# Altium schematic sheet PowerManagement.SchDoc: Alimentação e proteções
size 420 x 297 mm; Author: Matheus Markies; DrawnBy: Matheus Markies; Engineer: Matheus Markies; DocumentNumber: ECTU-SCH-09; Revision: A definir; SheetNumber: 9; SheetTotal: 12; ProjectTitle: ROUTE ECU / ECTU; DocumentStatus: Em desenvolvimento; DocumentDate: 14/10/2026
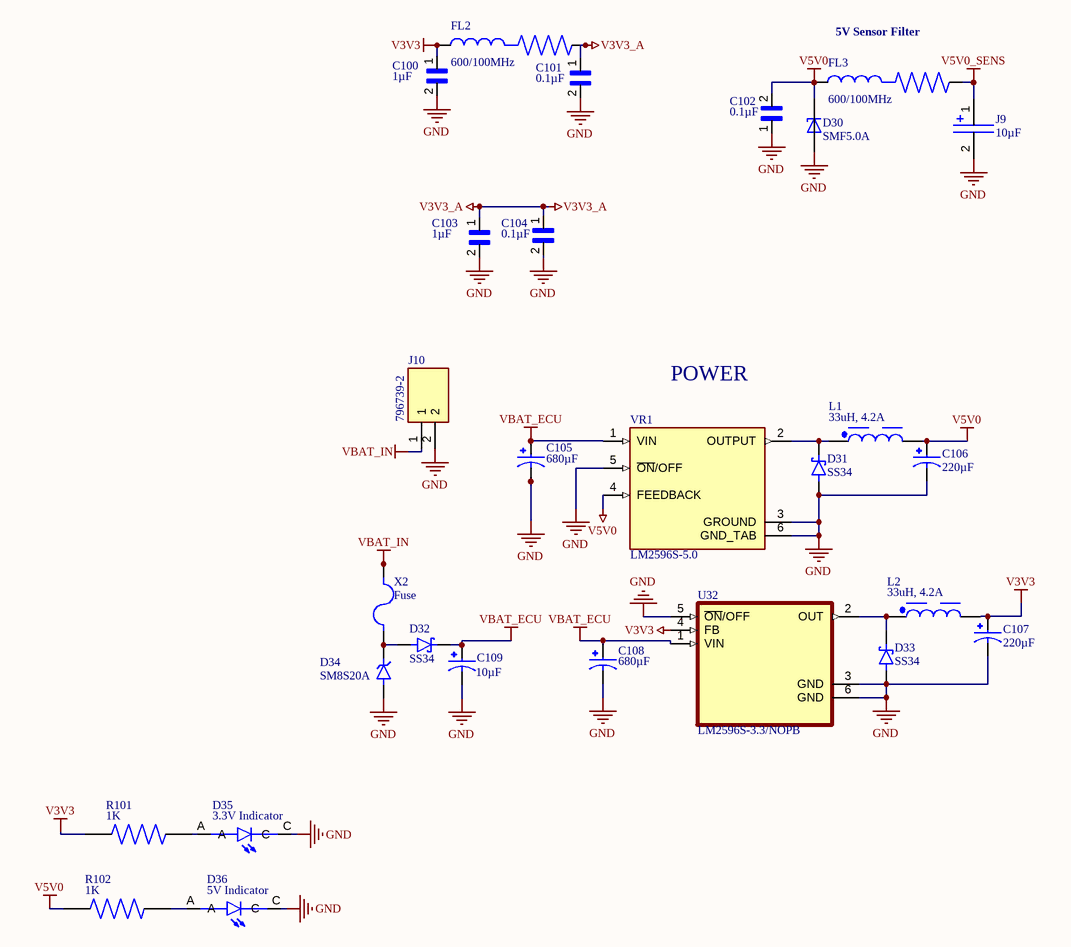
[diagram p0: PowerManagement.SchDoc]

## Parts
C100  1µF  [CAPC1608X90N]
C101  0.1µF  [CAPC1608X90N]
C102  0.1µF  [CAPC1608X90N]
C103  1µF  [CAPC1608X90N]
C104  0.1µF  [CAPC1608X90N]
C105  680µF  [CAP_EEEFN1E681UV]
C106  220µF  [CAP_EEEFP1V221AV]
C107  220µF  [CAP_EEEFP1V221AV]
C108  680µF  [CAP_EEEFN1E681UV]
C109  10µF  [CAPPRD500W50D500H1100]
D30  SMF5.0A  [SODFL3718X102N]
D31  SS34  [DIO_SS34]
D32  SS34  [DIO_SS34]
D33  SS34  [DIO_SS34]
D34  SM8S20A  [TVSP_SM8S36A]
D35  3.3V Indicator  [LEDC2012X70N]
D36  5V Indicator  [LEDC2012X70N]
FL2  600/100MHz  [BEADC1608X95N]
FL3  600/100MHz  [BEADC1608X95N]
J9  10µF  [T491A106K010AT]
J10  796739-2  [TE_796739-2]
L1  33uH, 4.2A  [WE-PD_1210]
L2  33uH, 4.2A  [WE-PD_1210]
R101  1K  [RESC3116X65N]
R102  1K  [RESC3116X65N]
U32  LM2596S-3.3/NOPB  [VREG_LM2596S-3.3/NOPB]
VR1  LM2596S-5.0  [TO170P1524X483-6N]
X2  Fuse  [FUSE_3522-2]

## Nets
GND: C100.2 C101.2 C102.1 C103.2 C104.2 C105.2 C106.2 C107.2 C108.2 C109.N D30.A D31.A D33.A D34.2(A) D35.C D36.C J9.2(P$2) J10.2 U32.3(GND) U32.5(~{ON}/OFF) U32.6(GND) VR1.3(GROUND) VR1.5(~{ON}/OFF) VR1.6(GND_TAB)
V3V3: C100.1 C107.1 FL2.1 L2.2 R101.1 U32.4(FB)
V3V3_A: C101.1 C103.1 C104.1 FL2.2
V5V0: C102.2 C106.1 D30.C FL3.1 L1.2 R102.1 VR1.4(FEEDBACK)
V5V0_SENS: FL3.2 J9.1(P$1)
VBAT_ECU: C105.1 C108.1 C109.P D32.C(K) U32.1(VIN) VR1.1(VIN)
VBAT_IN: J10.1 X2.2A X2.2B
NetD31_C: D31.C(K) L1.1 VR1.2(OUTPUT)
NetD32_A: D32.A D34.1(K) X2.1A X2.1B
NetD33_C: D33.C(K) L2.1 U32.2(OUT)
NetD35_A: D35.A R101.2
NetD36_A: D36.A R102.2

## Notes on the sheet
- (near FL3) 5V Sensor Filter
- POWER
- PROJETO
- STATUS
- FOLHA / SUBSISTEMA
- AUTOR
- CÓDIGO DO DESENHO
- ARQUIVO
- ATUALIZAÇÃO
- REVISÃO
- FOLHA
- FORMATO
- A3
- /

## Library data of the parts
C100-C104 = 06035C104MAZ2A: Multilayer Ceramic Capacitors MLCC - SMD/SMT; Package: None; Price: None; Value: *; MP: 06035C104MAZ2A; Availability: Unavailable
C105 C108 = EEEFN1E681UV: CAP ALUM 680UF 20% 25V SMD; MF: Panasonic Electronic Components; MP: EEE-FN1E681UV; Value: *; Purchase-URL: https://pricing.snapeda.com/search/part/EEE-FN1E681UV/?ref=eda; Price: None; Check_prices: https://www.snapeda.com/parts/EEE-FN1E681UV/Panasonic/view-part/6178425/?ref=eda; Package: RADIAL-2 Panasonic; Availability: In Stock; SnapEDA_Link: https://www.snapeda.com/parts/EEE-FN1E681UV/Panasonic/view-part/6178425/?ref=snap
C106 C107 = EEEFP1V221AV: CAP ALUM 220UF 20% 35V SMD; MF: Panasonic Electronic Components; MP: EEE-FP1V221AV; SnapEDA_Link: https://www.snapeda.com/parts/EEE-FP1V221AV/Panasonic/view-part/4900934/?ref=snap; Price: None; Availability: Not in stock; Value: *; Check_prices: https://www.snapeda.com/parts/EEE-FP1V221AV/Panasonic/view-part/4900934/?ref=eda; Package: RADIAL-2 Panasonic
C109 = ECEA1EN100UB: 10ÂµF 25V Aluminum Electrolytic Capacitors Radial, Can 2000 Hrs @ 85Â°C; MF: Panasonic; SnapEDA_Link: https://www.snapeda.com/parts/ECEA1EN100UB/Panasonic/view-part/?ref=snap; Price: None; Check_prices: https://www.snapeda.com/parts/ECEA1EN100UB/Panasonic/view-part/?ref=eda; Purchase-URL: https://pricing.snapeda.com/search/part/ECEA1EN100UB/?ref=eda; Package: RADIAL-2 Panasonic; MP: ECEA1EN100UB; Value: *; Availability: In Stock
D30 = SMF5.0A: 200W, 6.7V, 5%, Unidirectional, TVS; MF: Taiwan Semiconductor; SnapEDA_Link: https://www.snapeda.com/parts/SMF5.0A/taiwan/view-part/?ref=snap; Package: SOD-123W-2 Taiwan Semiconductor; Value: *; MP: SMF5.0A; Check_prices: https://www.snapeda.com/parts/SMF5.0A/taiwan/view-part/?ref=eda
D31-D33 = SS34: 3A, 40V, Schottky Rectifier; MF: Taiwan Semiconductor; Package: DO-214AB-2 Taiwan Semiconductor; Value: *; MP: SS34
  D31 D33: SnapEDA_Link: https://www.snapeda.com/parts/SS34/Taiwan+Semiconductor/view-part/?ref=snap; Check_prices: https://www.snapeda.com/parts/SS34/Taiwan+Semiconductor/view-part/?ref=eda
  D32: SnapEDA_Link: https://www.snapeda.com/parts/SS34/taiwan/view-part/?ref=snap; Check_prices: https://www.snapeda.com/parts/SS34/taiwan/view-part/?ref=eda
D34 = SM8S36A: Package: None; Price: None; Value: *; MP: SM8S36A; Availability: Unavailable
D35 D36 = 597-3305-607F: LED Uni-Color Green 4-Pin Chip 0805 T/R; Availability: Unavailable; Value: *; Price: None; MP: 597-3305-607F; Package: None
FL2 FL3 = BLM18DN601SZ1D: 600 Ohms @ 100MHz 1 Ferrite Bead 0603 _1608 Metric_ 700mA; MF: Murata; Package: 1608 Murata; Availability: Unavailable; Value: *; MP: BLM18DN601SZ1D; SnapEDA_Link: https://www.snapeda.com/parts/BLM18DN601SZ1D/Murata/view-part/4302620/?ref=snap; Price: None
J9 = T491A106K010AT: Condensador electrolÃ­tico de tantalio sÃ³lido MnO2 de 10 ÂµF, 10 V CC +/-10 %, serie T491 ¦ KEMET T491A106K010AT; SnapEDA_Link: https://www.snapeda.com/parts/T491A106K010AT/KEMET/view-part/?ref=snap; Package: SMD-2 KEMET; Value: *; MF: KEMET; MP: T491A106K010AT; Check_prices: https://www.snapeda.com/parts/T491A106K010AT/KEMET/view-part/?ref=eda
J10 = 796739-2: Conn Terminal Block F 2 POS 9.53mm Solder RA Thru-Hole 32A/Contact; MF: TE Connectivity; Number_of_Positions: 2; Centerline_Pitch: 9.53 mm[.375 in]; Package: None; Value: *; Price: None; EU_RoHS_Compliance: Compliant with Exemptions; MP: 796739-2; TE_purchase_URL: https://www.te.com/usa-en/product-796739-2.html?te_bu=Cor&te_type=disp&te_campaign=seda_glo_cor-seda-global-disp-prtnr-fy19-seda-model-bom-cta_sma-317_1&elqCampaignId=32493; Availability: Unavailable; SnapEDA_Link: https://www.snapeda.com/parts/796739-2/TE%20Connectivity%20AMP%20Connectors/view-part/279084/?ref=snap
L1 L2 = 7447709330: WE-PD SMT Power Inductor, size 1210, 33uH, 4.2A, 45mOhm; Manufacturer: Wurth Elektronik; Case/Size Code: 1210; DC Resistance: 37mOhm; Saturation Current: 5.5A; Self Resonant Frequency: 8.5MHz; Type: Standard; Manufacturer Part Number: 7447709330; Category: Power Inductors; Match Code: WE-PD; ComponentLink1Description: Website Link; ComponentLink1URL: https://www.we-online.com/redexpert/article/7447709330?ad; ComponentLink2Description: Datasheet Link; ComponentLink2URL: https://www.we-online.com/redexpert/spec/7447709330?ad; Mount: Surface Mount; Operating Temperature Max: 125°C; Operating Temperature Min: -40°C; Packaging: Tape and Reel; Length: 12mm; Width: 12mm; Height: 10mm; DC Resistance Max: 45mOhm; Inductance: 33uH; Rated Current: 4.2A
R101 R102 = RC1206JR-071KL: RES, THICK FILM, 1K, 5%, 0.25W, 1206; Resistance:1kohm; Resistance Tolerance:Â± 5%; Power Rating:250mW; Resistor Case Style:1206 ^3216 Metric]; Resistor Technology:Thick Film; Resistor Type:General Purpose; Product Range:RC Series; MF: Yageo Corporation; MP: RC1206JR071KL; SnapEDA_Link: https://www.snapeda.com/parts/RC1206JR071KL/Yageo/view-part/?ref=snap; Package: 1206-2 YAGEO; Value: *; Check_prices: https://www.snapeda.com/parts/RC1206JR071KL/Yageo/view-part/?ref=eda
VR1 = LM2596S-5.0: SIMPLE SWITCHER&reg; 4.5V to 40V, 3A Low Component Count Step-Down Regulator; MP: LM2596S-5.0/NOPB; MF: Texas Instruments; Price: None; Availability: In Stock; Package: TO-263-5 Texas Instruments; SnapEDA_Link: https://www.snapeda.com/parts/LM2596S-5.0/NOPB/Texas+Instruments/view-part/?ref=snap; Check_prices: https://www.snapeda.com/parts/LM2596S-5.0/NOPB/Texas+Instruments/view-part/?ref=eda; Value: *; Purchase-URL: https://pricing.snapeda.com/search/part/LM2596S-5.0/NOPB/?ref=eda
X2 = 3522-2: MF: {'manufacturer': u'Keystone Electronics'}; Availability: Unavailable; Price: None; Value: *; MP: 3522-2; Package: None
U32 = LM2596S-3.3/NOPB: MP: LM2596S-3.3/NOPB; Availability: Unavailable; Package: None; Value: *; Price: None